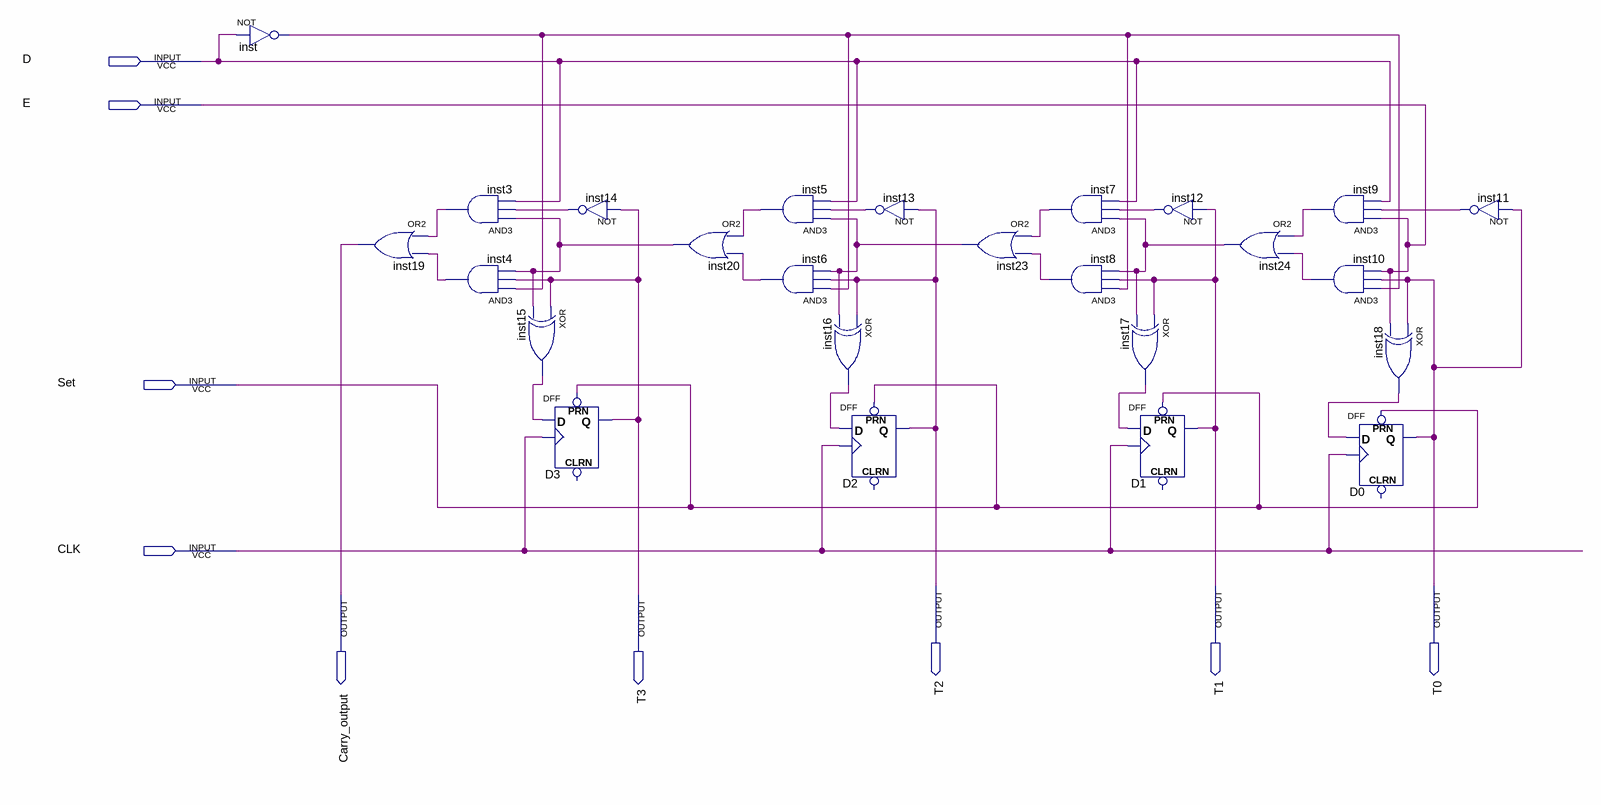
[diagram p0: schematic sheet]
// Quartus schematic 4bitupdowncounter.bdf as structural Verilog: 25 symbols, 9 pins
module \4bitupdowncounter  (
  input  D,
  input  E,
  input  Set,
  input  CLK,
  output T2,
  output T1,
  output T0,
  output Carry_output,
  output T3
);

  wire inst3_out, inst4_out, inst5_out, inst6_out, inst7_out, inst8_out, inst9_out, inst10_out, inst11_out,
       inst12_out, inst13_out, inst14_out, inst15_out, inst16_out, inst17_out, inst18_out, inst20_out,
       inst23_out, inst24_out, inst_out;

  not inst (inst_out, D);
  or inst19 (Carry_output, inst3_out, inst4_out);
  and inst3 (inst3_out, inst20_out, inst14_out, D);
  and inst4 (inst4_out, inst_out, T3, inst20_out);
  xor inst15 (inst15_out, T3, inst20_out);
  DFF D3 (.CLK(CLK), .D(inst15_out), .PRN(Set), .Q(T3));  // open: CLRN
  not inst14 (inst14_out, T3);
  or inst20 (inst20_out, inst5_out, inst6_out);
  and inst5 (inst5_out, inst23_out, inst13_out, D);
  and inst6 (inst6_out, inst_out, T2, inst23_out);
  xor inst16 (inst16_out, T2, inst23_out);
  not inst13 (inst13_out, T2);
  DFF D2 (.CLK(CLK), .D(inst16_out), .PRN(Set), .Q(T2));  // open: CLRN
  or inst23 (inst23_out, inst7_out, inst8_out);
  and inst7 (inst7_out, inst24_out, inst12_out, D);
  and inst8 (inst8_out, inst_out, T1, inst24_out);
  not inst12 (inst12_out, T1);
  xor inst17 (inst17_out, T1, inst24_out);
  DFF D1 (.CLK(CLK), .D(inst17_out), .PRN(Set), .Q(T1));  // open: CLRN
  or inst24 (inst24_out, inst9_out, inst10_out);
  and inst9 (inst9_out, E, inst11_out, D);
  and inst10 (inst10_out, inst_out, T0, E);
  xor inst18 (inst18_out, T0, E);
  DFF D0 (.CLK(CLK), .D(inst18_out), .PRN(Set), .Q(T0));  // open: CLRN
  not inst11 (inst11_out, T0);
endmodule
